# Altium project P.PrjPcb
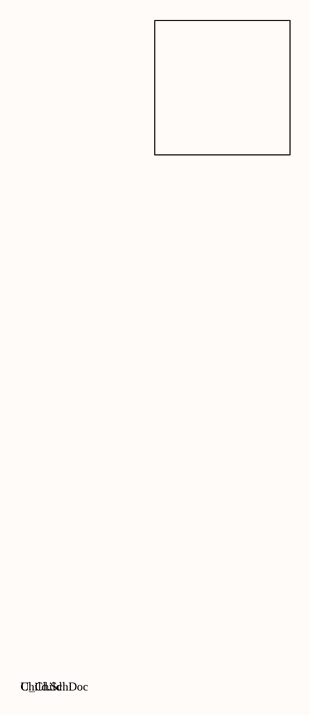
[diagram p0: Top.SchDoc]
2 sheets, 1 parts. Net scope: global (net labels, ports and power ports of the same name join across sheets).
Sheets:
  Top.SchDoc
    U_Child = Child.SchDoc

## Sheet Top.SchDoc
size A4

### Sub-sheets
U_Child = Child.SchDoc: no entries

## Sheet Child.SchDoc
size A4
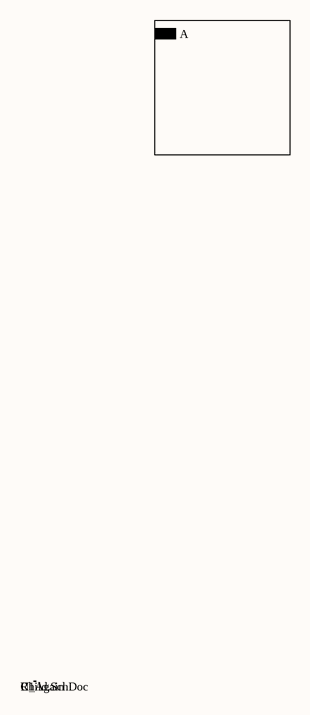
[diagram p1: Child.SchDoc]

### Parts
R1  (no value)

### Sub-sheets
U_Again = Child.SchDoc: A

### Nets

Not connected (* = marked no-connect by the designer): R1 1(A)

### Library data of the parts
R1 = RES